# EAGLE design NMEA-Sensorboard (EAGLE 9.6.2)
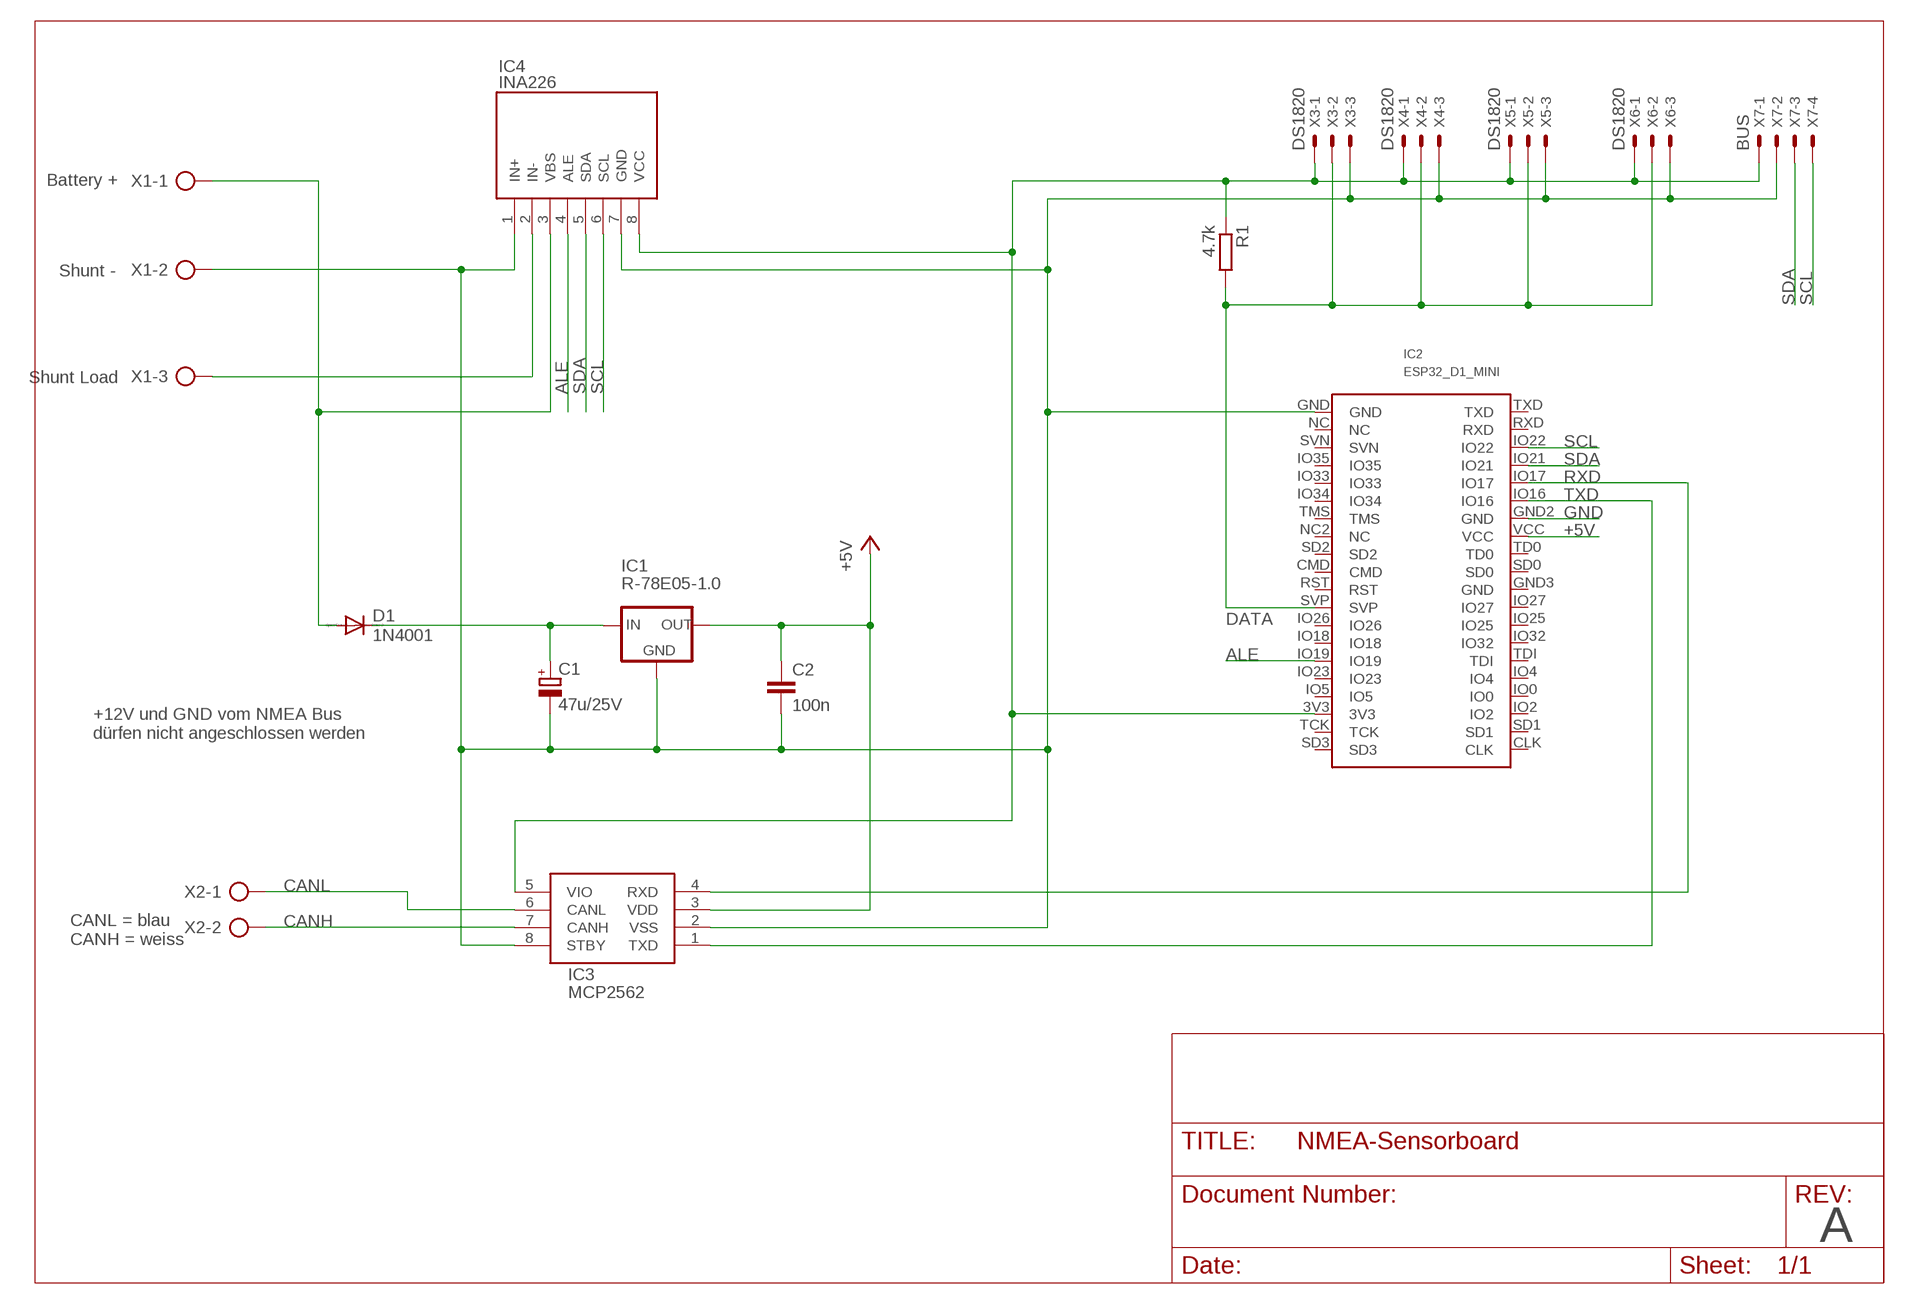
[diagram p0: schematic, sheet 1]

## Parts
C1  47u/25V  CPOL-EUE2-5  [E2-5]
C2  100n  C-EU050-024X044  [C050-024X044]
D1  1N4001  1N4148  [SOD80]
IC1  R-78E05-1.0  R-78E-XX1.0  [R-78E-XX1.0]
IC2  ESP32_D1_MINI  [ESP32_D1_MINI]
IC3  MCP2562  MCP2562SMD  [SO-8]
IC4  INA226  [INA226]
R1  4.7k  R-EU_R0805  [R0805]
X1  AK500/3  [AK500/3]
X2  AK500/2  [AK500/2]
X3  DS1820  22-23-2031  [22-23-2031]
X4  DS1820  22-23-2031  [22-23-2031]
X5  DS1820  22-23-2031  [22-23-2031]
X6  DS1820  22-23-2031  [22-23-2031]
X7  BUS  22-23-2041  [22-23-2041]

## Nets
12V: D1.A IC4.3(VBS) X1.1
+3V3: IC2.3V3 IC3.5(VIO) IC4.8(VCC) R1.1 X3.1 X4.1 X5.1 X6.1 X7.1
+5V: C2.1 IC1.OUT IC2.VCC IC3.3(VDD)
ALE: IC2.IO19 IC4.4(ALE)
CANH: IC3.7(CANH) X2.2
CANL: IC3.6(CANL) X2.1
DATA: IC2.SVP R1.2 X3.2 X4.2 X5.2 X6.2
GND: C1.- C2.2 IC1.GND IC2.GND IC2.GND2(GND) IC3.2(VSS) IC3.8(STBY) IC4.1(IN+) IC4.7(GND) X1.2 X3.3 X4.3 X5.3 X6.3 X7.2
LOAD: IC4.2(IN-) X1.3
N$8: C1.+ D1.C IC1.IN
RXD: IC2.IO17 IC3.4(RXD)
SCL: IC2.IO22 IC4.6(SCL) X7.4
SDA: IC2.IO21 IC4.5(SDA) X7.3
TXD: IC2.IO16 IC3.1(TXD)
Unconnected: IC2.CLK IC2.CMD IC2.GND3(GND) IC2.IO0 IC2.IO2 IC2.IO4 IC2.IO5 IC2.IO18 IC2.IO23 IC2.IO25 IC2.IO26 IC2.IO27 IC2.IO32 IC2.IO33 IC2.IO34 IC2.IO35 IC2.NC IC2.NC2(NC) IC2.RST IC2.RXD IC2.SD0 IC2.SD1 IC2.SD2 IC2.SD3 IC2.SVN IC2.TCK IC2.TD0 IC2.TDI IC2.TMS IC2.TXD

## Notes on the sheet
- Battery +
- Shunt -
- Shunt Load
- +12V und GND vom NMEA Bus 
  dürfen nicht angeschlossen werden
- CANL = blau
  CANH = weiss
- A

## Library data of the parts
C1 = rcl:CPOL-EU: POLARIZED CAPACITOR, European symbol; SPICEPREFIX: C
C2 = rcl:C-EU: CAPACITOR, European symbol; SPICEPREFIX: C
D1 = _smd:1N4148: DIODE high speed (Philips)
IC1 = _eigene:R-78E-XX1.0: VOLTAGE REGULATOR
IC2 = _esp32:ESP32_D1_MINI
IC3 = _eigene:MCP2562
IC4 = _eigene:INA226
R1 = rcl:R-EU_: RESISTOR, European symbol; SPICEPREFIX: R
X1 = con-ptr500:AK500/3: CONNECTOR; OC_FARNELL: unknown; OC_NEWARK: unknown
X2 = con-ptr500:AK500/2: CONNECTOR; OC_FARNELL: unknown; OC_NEWARK: unknown
X3-X6 = con-molex:22-23-2031: .100" (2.54mm) Center Header - 3 Pin; MF: MOLEX; MPN: 22-23-2031; OC_FARNELL: 1462950; OC_NEWARK: 30C0862
X7 = con-molex:22-23-2041: .100" (2.54mm) Center Header - 4 Pin; MF: MOLEX; MPN: 22-23-2041; OC_FARNELL: 1462920; OC_NEWARK: 38C0355

## Board
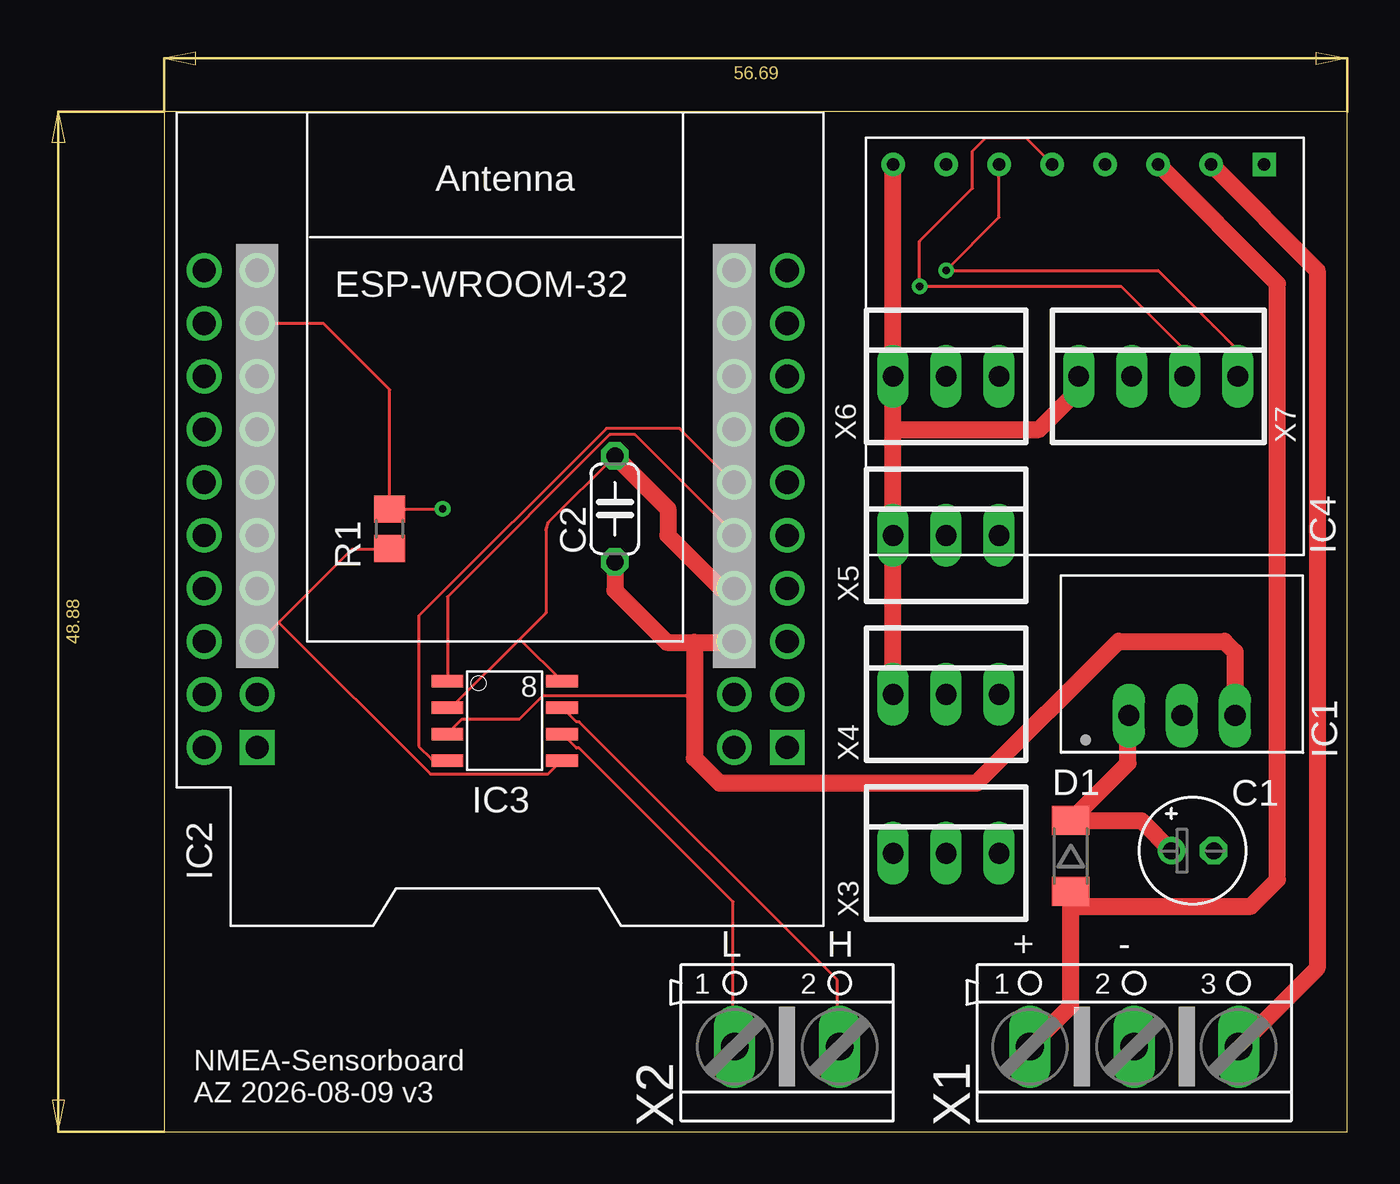
[diagram p1: board, top side]
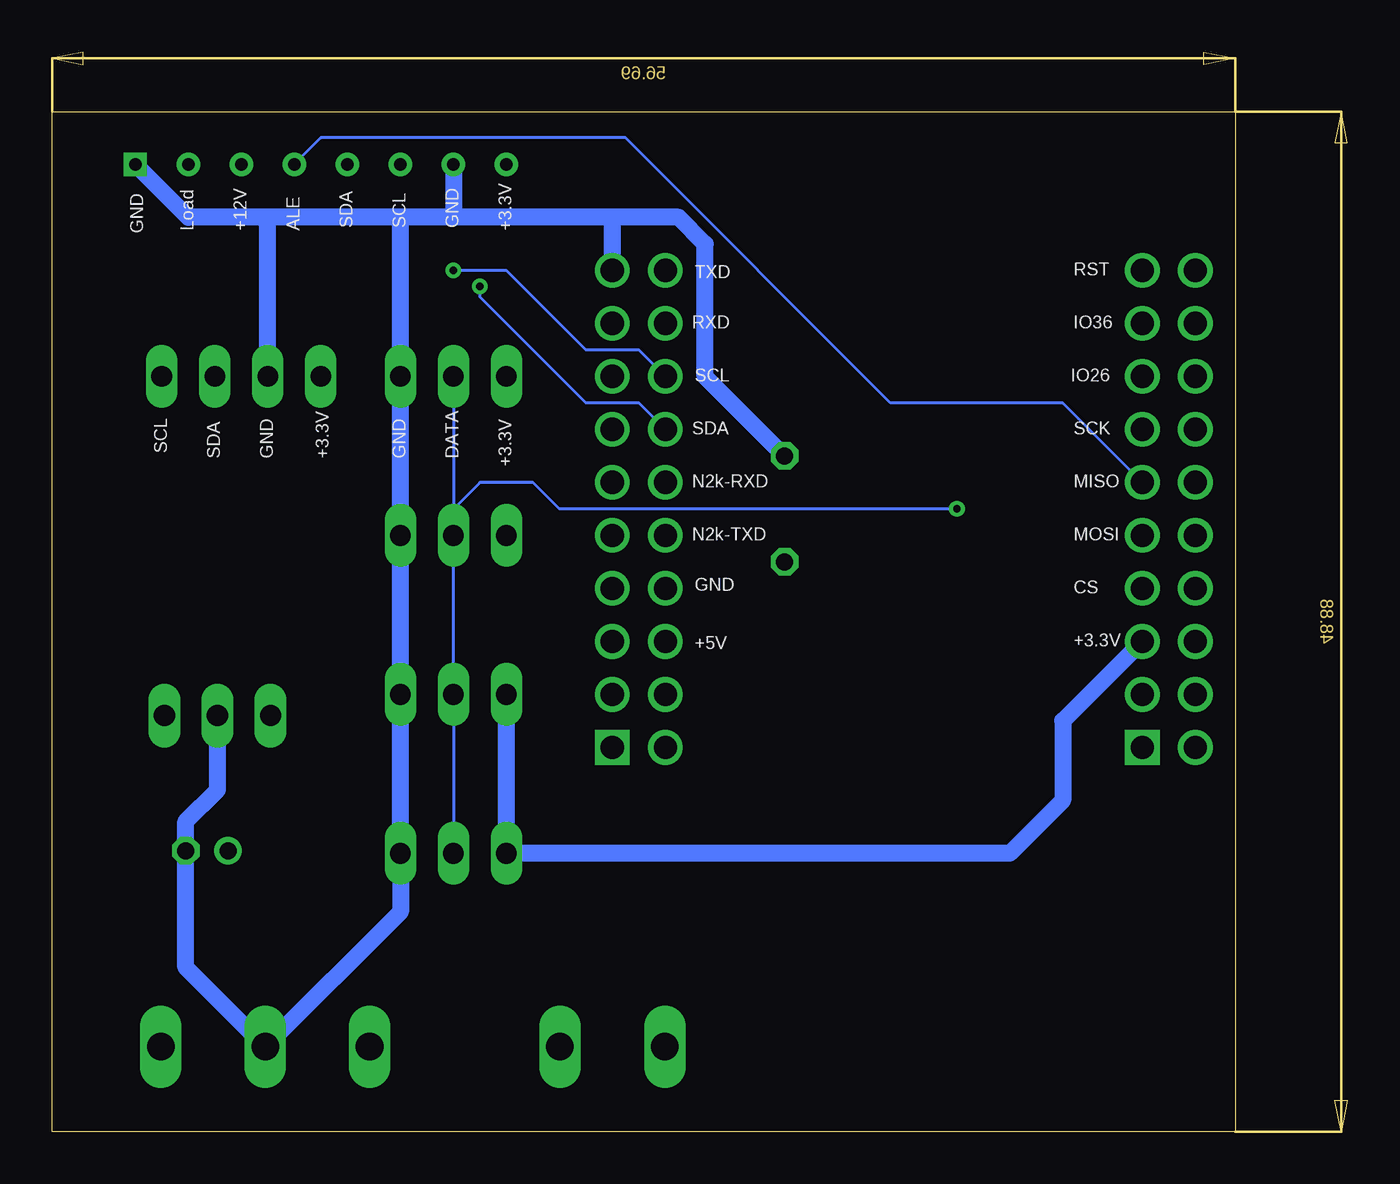
[diagram p2: board, bottom side, seen from below]

Size 56.69 x 48.88 mm. Coordinates in mm from the lower left corner, seen from the top.
Outline: 0,0 56.69,0 56.69,48.88 0,48.88 0,0
Copper layers (1*16): Top 0.035mm / dielectric 1.5mm / Bottom 0.035mm
Design rules "default": minimum track width 6mil, minimum drill 0.35mm, track to track 6mil, track to pad 6mil, pad to pad 6mil, via to via 6mil, smd to smd 6mil, copper to edge 40mil, drill to drill 6mil, minimum pad ring 10mil, minimum via ring 8mil, stop-mask expansion 4mil, vias tented up to drill 0mil, thermal gap 10mil

### Footprints (pad centres in the part's own frame; a part is rotated, then mirrored left to right if it is on the bottom)
E2-5 = drill 0.813 pad 1.27: + -1.016,0 | drill 0.813 pad 1.27 octagon: - 1.016,0
C050-024X044 = drill 0.813 octagon: 1 -2.54,0; 2 2.54,0
SOD80 = smd 1.4 x 1.8: A 1.7,0; C -1.7,0
R-78E-XX1.0 = drill 1.016 long: GND 0,-2.54; IN -2.54,-2.54; OUT 2.54,-2.54
ESP32_D1_MINI = drill 1.11 pad 1.665: 3V3 25.4,-5.08; CMD 27.94,0; GND 0,-22.86; GND2 2.54,-7.62; GND3 27.94,-22.86; IO0 0,-7.62; IO2 0,-5.08; IO4 0,-10.16; IO5 25.4,-7.62; IO16 2.54,-10.16; IO17 2.54,-12.7; IO18 25.4,-15.24; IO19 25.4,-12.7; IO21 2.54,-15.24; IO22 2.54,-17.78; IO23 25.4,-10.16; IO25 0,-17.78; IO26 25.4,-17.78; IO27 0,-20.32; IO32 0,-15.24; IO33 27.94,-12.7; IO34 27.94,-10.16; IO35 27.94,-15.24; NC 27.94,-20.32; NC2 27.94,-5.08; RST 25.4,-22.86; RXD 2.54,-20.32; SD0 2.54,0; SD1 0,-2.54; SD2 27.94,-2.54; SVN 27.94,-17.78; SVP 25.4,-20.32; TCK 25.4,-2.54; TD0 2.54,-2.54; TDI 0,-12.7; TMS 27.94,-7.62; TXD 2.54,-22.86; VCC 2.54,-5.08 | drill 1.11 pad 1.665 square: CLK 0,0; SD3 25.4,0
SO-8 = smd 1.524 x 0.61: 1 -2.743,1.905; 2 -2.743,0.635; 3 -2.743,-0.635; 4 -2.743,-1.905; 5 2.743,-1.905; 6 2.743,-0.635; 7 2.743,0.635; 8 2.743,1.905
INA226 = drill 0.6 square: 1 1.27,1.27 | drill 0.6: 2 3.81,1.27; 3 6.35,1.27; 4 8.89,1.27; 5 11.43,1.27; 6 13.97,1.27; 7 16.51,1.27; 8 19.05,1.27
R0805 = smd 1.3 x 1.5: 1 -0.95,0; 2 0.95,0
AK500/3 = drill 1.321 long: 1 -5.004,0; 2 0,0; 3 5.004,0
AK500/2 = drill 1.321 long: 1 -2.515,0; 2 2.515,0
22-23-2031 = drill 1 long: 1 -2.54,0; 2 0,0; 3 2.54,0
22-23-2041 = drill 1 long: 1 -3.81,0; 2 -1.27,0; 3 1.27,0; 4 3.81,0

### Placement (x,y rotation side)
C1  49.28,13.46 0 top
C2  21.59,29.85 90 top
D1  43.43,13.21 270 top
IC1  48.77,22.48 0 top
IC2  29.84,18.42 180 top
IC3  16.31,19.69 0 top
IC4  53.98,47.62 180 top
R1  10.79,28.9 90 top
X1  46.48,4.06 0 top
X2  29.84,4.06 0 top
X3  37.47,13.33 0 top
X4  37.47,20.96 0 top
X5  37.47,28.58 0 top
X6  37.47,36.2 0 top
X7  47.62,36.2 0 top

### Tracks (layer width: path | path; a pad name or v marks a point on that pad's centre or on a via)
12V
  Top 0.813: IC4.3 53.34,40.64 53.34,12.06 52.07,10.79 43.43,10.79 | X1.1 43.43,6.02 43.43,10.79 | 43.43,10.79 D1.A
+3V3
  Top 0.152: 10.67,28.07 R1.1 10.67,27.92 8.99,27.92 5.48,24.4 | 5.48,24.4 4.57,23.5 IC2.3V3 | 5.48,24.4 12.75,17.14 18.38,17.14 19,17.76 IC3.5
  Top 0.813: X4.1 X5.1 34.92,33.66 | 34.92,33.66 X6.1 IC4.8 | 34.92,33.66 41.91,33.66 43.81,35.56 X7.1
  Bottom 0.813: IC2.3V3 8.26,19.69 8.26,15.88 10.79,13.33 X3.1 X4.1
+5V
  Top 0.152: 27.25,23.44 IC2.VCC | 13.56,19.08 IC3.3 13.62,19.14 14.25,19.76 17,19.76 18.12,20.89 25.4,20.89
  Top 0.813: IC1.OUT 51.31,22.99 50.8,23.5 45.72,23.5 38.92,16.7 26.61,16.7 25.4,17.91 25.4,20.89 25.4,23.44 | C2.1 21.59,25.93 24.08,23.44 25.4,23.44 | 25.4,23.44 27.25,23.44
ALE
  Bottom 0.152: IC4.4 43.81,47.62 29.21,47.62 16.51,34.92 8.26,34.92 IC2.IO19
CANH
  Top 0.152: IC3.7 19.12,20.26 19.75,19.64 19.88,19.64 32.25,7.26 32.25,4.13 X2.2
CANL
  Top 0.152: IC3.6 19.12,19.01 19.75,18.39 19.88,18.39 27.25,11.01 27.25,4.13 X2.1
DATA  (via drill 0.35)
  Top 0.152: v13.34,29.85 R1.2 10.79,35.56 7.62,38.73 IC2.SVP
  Bottom 0.152: X6.2 X5.2 | X3.2 X4.2 X5.2 | X5.2 37.47,29.85 36.2,31.12 33.66,31.12 32.38,29.85 v13.34,29.85
GND
  Top 0.152: C2.2 18.41,29.21 18.29,28.83 18.29,24.87 16.97,23.54 | 16.97,23.54 13.87,20.45 13.56,20.45 IC3.2 | IC3.8 19,21.64 17.12,23.51 17,23.51 16.97,23.54
  Top 0.813: C2.2 24.13,29.85 24.13,28.58 26.67,26.04 IC2.GND2
  Bottom 0.813: C2.2 25.4,36.2 25.4,42.54 26.67,43.81 29.84,43.81 | IC4.1 50.16,43.81 46.61,43.81 | 29.84,43.81 37.59,43.81 | 37.59,43.81 39.88,43.81 | 39.88,43.81 46.61,43.81 | IC4.7 37.47,43.94 37.59,43.81 | IC2.GND 29.84,43.81 | 39.88,43.81 40.01,43.69 X6.3 X5.3 X4.3 X3.3 40.01,10.54 X1.2 50.29,7.87 C1.- 50.29,14.86 48.77,16.38 IC1.GND | X7.2 46.35,43.56 46.61,43.81
LOAD
  Top 0.813: IC4.2 55.24,41.27 55.24,7.82 X1.3
N$8
  Top 0.813: IC1.IN 46.18,19.89 46.18,17.65 D1.C 46.81,14.91 C1.+
RXD
  Top 0.152: IC3.4 13.56,17.86 12.8,17.86 12.19,18.47 12.19,24.71 21.18,33.71 24.69,33.71 27.28,31.12 IC2.IO17
SCL  (via drill 0.35)
  Top 0.152: X7.4 51.44,37.46 47.62,41.27 v37.47,41.27 40.01,43.81 IC4.6
  Bottom 0.152: IC2.IO22 28.57,37.46 31.11,37.46 34.92,41.27 v37.47,41.27
SDA  (via drill 0.35)
  Top 0.152: X7.3 48.9,37.46 45.85,40.51 v36.2,40.51 36.2,42.67 38.73,45.21 38.73,46.99 39.37,47.62 41.27,47.62 IC4.5
  Bottom 0.152: IC2.IO21 28.57,34.92 31.11,34.92 36.2,40 v36.2,40.51
TXD
  Top 0.152: IC3.1 13.56,25.63 21.34,33.4 22.55,33.4 27.28,28.68 IC2.IO16

### Text on the board
tNames: L | H | + | - | NMEA-Sensorboard / AZ 2026-08-09 v3
bNames: +3.3V | GND | SCL | SDA | ALE | +12V | Load | GND | RST | TXD | IO36 | RXD | IO26 | SCL | SCK | SDA | DATA | GND | +3.3V | GND | SDA | SCL | +3.3V | MISO | N2k-RXD | MOSI | N2k-TXD | CS | GND | +3.3V | +5V